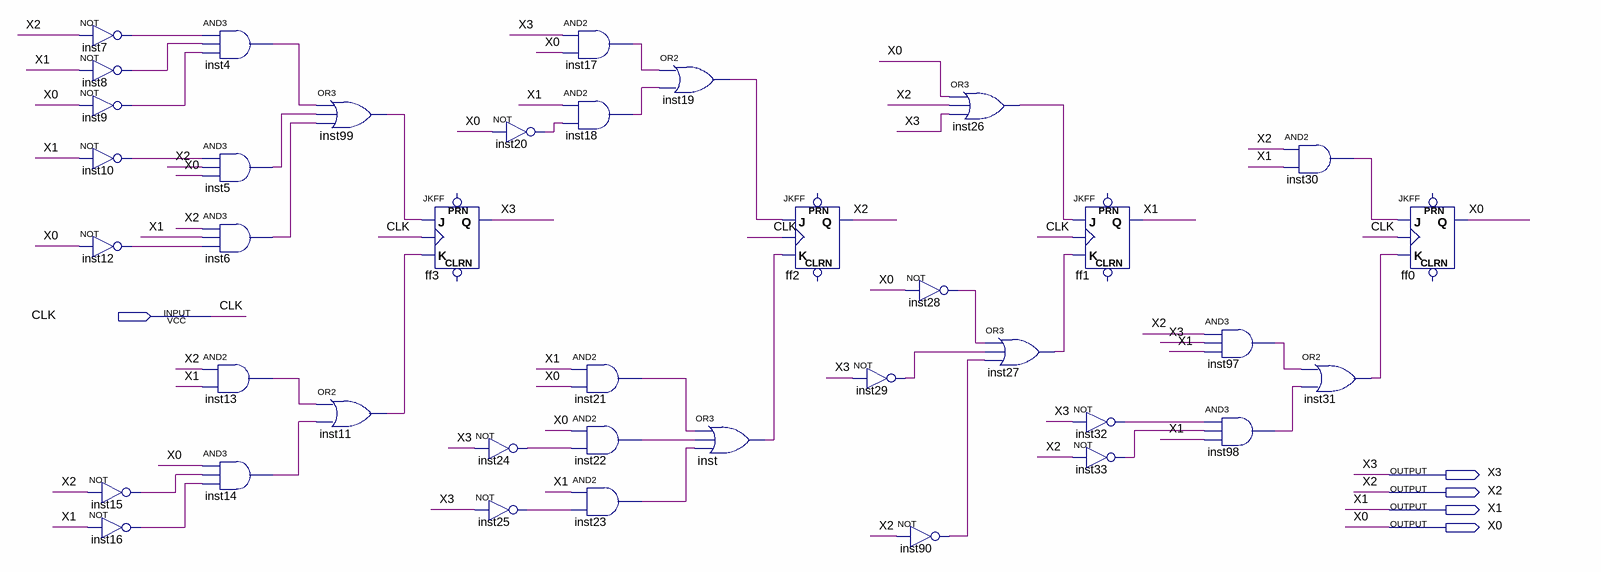
[diagram p0: schematic sheet]
// Quartus schematic SMschematic.bdf as structural Verilog: 39 symbols, 5 pins
module SMschematic (
  input  CLK,
  output X3,
  output X2,
  output X1,
  output X0
);

  wire inst4_out, inst5_out, inst6_out, inst7_out, inst8_out, inst9_out, inst10_out, inst11_out, inst12_out,
       inst13_out, inst14_out, inst15_out, inst16_out, inst17_out, inst18_out, inst19_out, inst20_out,
       inst21_out, inst22_out, inst23_out, inst24_out, inst25_out, inst26_out, inst27_out, inst28_out,
       inst29_out, inst30_out, inst31_out, inst32_out, inst33_out, inst90_out, inst97_out, inst98_out,
       inst99_out, inst_out;

  not inst7 (inst7_out, X2);
  not inst8 (inst8_out, X1);
  not inst9 (inst9_out, X0);
  not inst10 (inst10_out, X1);
  not inst12 (inst12_out, X0);
  not inst15 (inst15_out, X2);
  not inst16 (inst16_out, X1);
  and inst4 (inst4_out, inst7_out, inst8_out, inst9_out);
  and inst5 (inst5_out, inst10_out, X2, X0);
  and inst6 (inst6_out, X2, X1, inst12_out);
  and inst13 (inst13_out, X2, X1);
  and inst14 (inst14_out, X0, inst15_out, inst16_out);
  or inst99 (inst99_out, inst4_out, inst5_out, inst6_out);
  or inst11 (inst11_out, inst13_out, inst14_out);
  JKFF ff3 (.K(inst11_out), .J(inst99_out), .CLK(CLK), .Q(X3));  // open: PRN, CLRN
  not inst20 (inst20_out, X0);
  not inst24 (inst24_out, X3);
  not inst25 (inst25_out, X3);
  and inst17 (inst17_out, X3, X0);
  and inst18 (inst18_out, X1, inst20_out);
  and inst21 (inst21_out, X1, X0);
  and inst22 (inst22_out, X0, inst24_out);
  and inst23 (inst23_out, X1, inst25_out);
  or inst19 (inst19_out, inst17_out, inst18_out);
  or inst (inst_out, inst21_out, inst22_out, inst23_out);
  JKFF ff2 (.K(inst_out), .J(inst19_out), .CLK(CLK), .Q(X2));  // open: PRN, CLRN
  not inst28 (inst28_out, X0);
  not inst29 (inst29_out, X3);
  not inst90 (inst90_out, X2);
  or inst26 (inst26_out, X0, X2, X3);
  or inst27 (inst27_out, inst28_out, inst29_out, inst90_out);
  JKFF ff1 (.K(inst27_out), .J(inst26_out), .CLK(CLK), .Q(X1));  // open: PRN, CLRN
  not inst32 (inst32_out, X3);
  not inst33 (inst33_out, X2);
  and inst97 (inst97_out, X2, X3, X1);
  and inst98 (inst98_out, inst32_out, inst33_out, X1);
  and inst30 (inst30_out, X2, X1);
  or inst31 (inst31_out, inst97_out, inst98_out);
  JKFF ff0 (.K(inst31_out), .J(inst30_out), .CLK(CLK), .Q(X0));  // open: PRN, CLRN
endmodule
